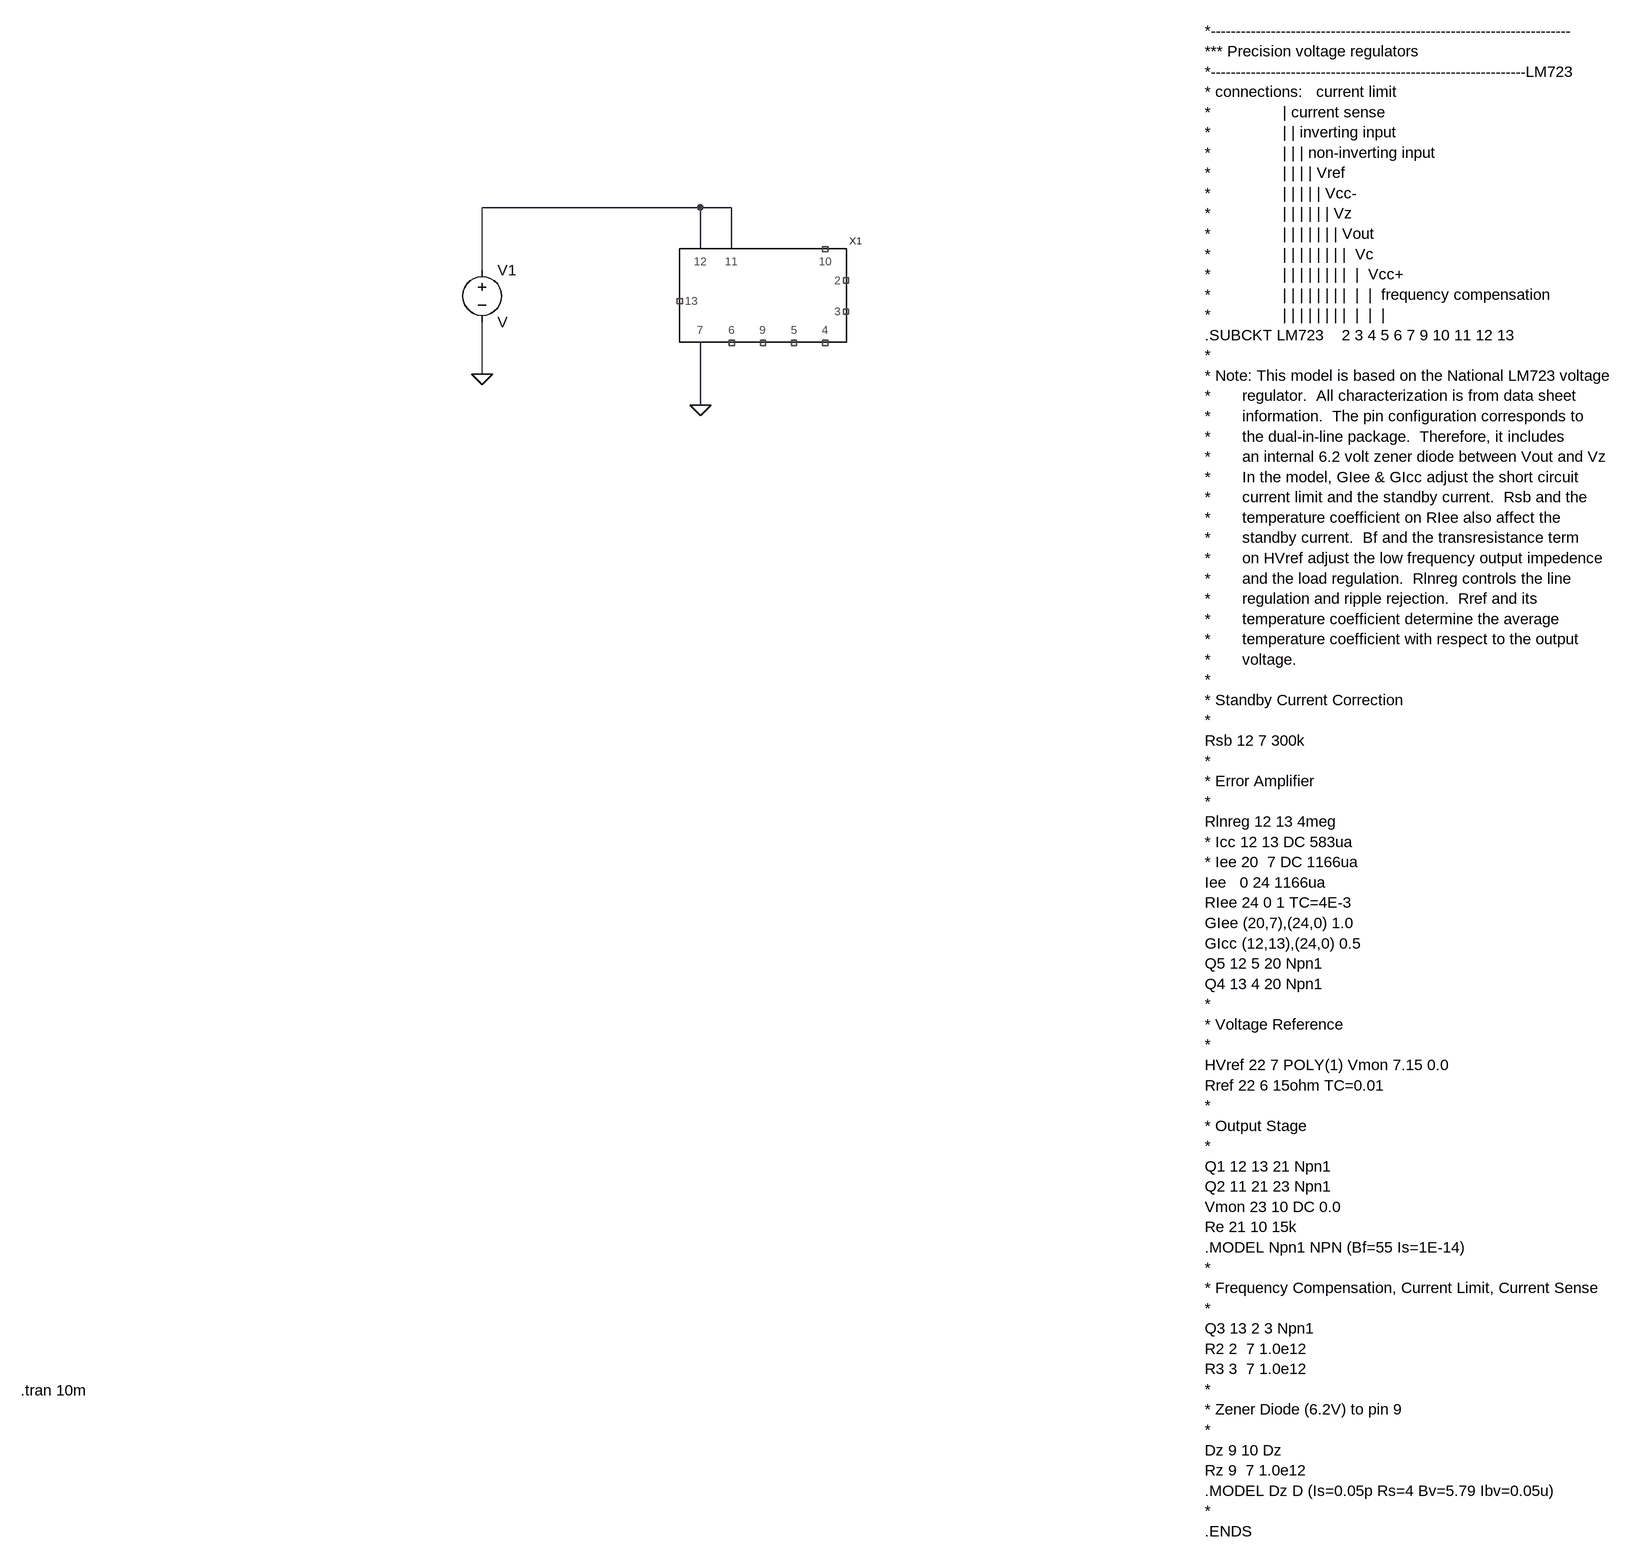
[diagram p0: schematic Draft2.asc]
Draft2.asc, the LTspice schematic file:
Version 4
SHEET 1 2652 1644
WIRE 1120 -192 784 -192
WIRE 1168 -192 1120 -192
WIRE 1120 -128 1120 -192
WIRE 1168 -128 1168 -192
WIRE 784 -96 784 -192
WIRE 784 64 784 -16
WIRE 1120 112 1120 16
FLAG 784 64 0
FLAG 1120 112 0
SYMBOL LM723 1216 -48 R0
SYMATTR InstName X1
SYMATTR Prefix X
SYMATTR SpiceModel LM723
SYMBOL voltage 784 -112 R0
SYMATTR InstName V1
TEXT 1896 -464 Left 2 !*------------------------------------------------------------------------\n*** Precision voltage regulators\n*---------------------------------------------------------------LM723\n* connections:   current limit\n*                | current sense\n*                | | inverting input\n*                | | | non-inverting input\n*                | | | | Vref\n*                | | | | | Vcc-\n*                | | | | | | Vz\n*                | | | | | | | Vout\n*                | | | | | | | |  Vc\n*                | | | | | | | |  |  Vcc+\n*                | | | | | | | |  |  |  frequency compensation\n*                | | | | | | | |  |  |  |\n.SUBCKT LM723    2 3 4 5 6 7 9 10 11 12 13\n*\n* Note: This model is based on the National LM723 voltage\n*       regulator.  All characterization is from data sheet\n*       information.  The pin configuration corresponds to\n*       the dual-in-line package.  Therefore, it includes\n*       an internal 6.2 volt zener diode between Vout and Vz\n*       In the model, GIee & GIcc adjust the short circuit\n*       current limit and the standby current.  Rsb and the\n*       temperature coefficient on RIee also affect the\n*       standby current.  Bf and the transresistance term\n*       on HVref adjust the low frequency output impedence\n*       and the load regulation.  Rlnreg controls the line\n*       regulation and ripple rejection.  Rref and its\n*       temperature coefficient determine the average\n*       temperature coefficient with respect to the output\n*       voltage.\n*\n* Standby Current Correction\n*\nRsb 12 7 300k\n*\n* Error Amplifier\n*\nRlnreg 12 13 4meg\n* Icc 12 13 DC 583ua\n* Iee 20  7 DC 1166ua\nIee   0 24 1166ua\nRIee 24 0 1 TC=4E-3\nGIee (20,7),(24,0) 1.0\nGIcc (12,13),(24,0) 0.5\nQ5 12 5 20 Npn1\nQ4 13 4 20 Npn1\n*\n* Voltage Reference\n*\nHVref 22 7 POLY(1) Vmon 7.15 0.0\nRref 22 6 15ohm TC=0.01\n*\n* Output Stage\n*\nQ1 12 13 21 Npn1\nQ2 11 21 23 Npn1\nVmon 23 10 DC 0.0\nRe 21 10 15k\n.MODEL Npn1 NPN (Bf=55 Is=1E-14)\n*\n* Frequency Compensation, Current Limit, Current Sense\n*\nQ3 13 2 3 Npn1\nR2 2  7 1.0e12\nR3 3  7 1.0e12\n*\n* Zener Diode (6.2V) to pin 9\n*\nDz 9 10 Dz\nRz 9  7 1.0e12\n.MODEL Dz D (Is=0.05p Rs=4 Bv=5.79 Ibv=0.05u)\n*\n.ENDS
TEXT 74 1628 Left 2 !.tran 10m

The netlist it stands for:
* Draft2.asc
XX1 NC_01 NC_02 NC_03 NC_04 NC_05 0 NC_06 NC_07 N001 N001 NC_08 LM723  ; pins 2 3 4 5 6 7 9 10 11 12 13
V1 N001 0 V
*------------------------------------------------------------------------
*** Precision voltage regulators
*---------------------------------------------------------------LM723
* connections:   current limit
*                | current sense
*                | | inverting input
*                | | | non-inverting input
*                | | | | Vref
*                | | | | | Vcc-
*                | | | | | | Vz
*                | | | | | | | Vout
*                | | | | | | | |  Vc
*                | | | | | | | |  |  Vcc+
*                | | | | | | | |  |  |  frequency compensation
*                | | | | | | | |  |  |  |
.SUBCKT LM723    2 3 4 5 6 7 9 10 11 12 13
*
* Note: This model is based on the National LM723 voltage
*       regulator.  All characterization is from data sheet
*       information.  The pin configuration corresponds to
*       the dual-in-line package.  Therefore, it includes
*       an internal 6.2 volt zener diode between Vout and Vz
*       In the model, GIee & GIcc adjust the short circuit
*       current limit and the standby current.  Rsb and the
*       temperature coefficient on RIee also affect the
*       standby current.  Bf and the transresistance term
*       on HVref adjust the low frequency output impedence
*       and the load regulation.  Rlnreg controls the line
*       regulation and ripple rejection.  Rref and its
*       temperature coefficient determine the average
*       temperature coefficient with respect to the output
*       voltage.
*
* Standby Current Correction
*
Rsb 12 7 300k
*
* Error Amplifier
*
Rlnreg 12 13 4meg
* Icc 12 13 DC 583ua
* Iee 20  7 DC 1166ua
Iee   0 24 1166ua
RIee 24 0 1 TC=4E-3
GIee (20,7),(24,0) 1.0
GIcc (12,13),(24,0) 0.5
Q5 12 5 20 Npn1
Q4 13 4 20 Npn1
*
* Voltage Reference
*
HVref 22 7 POLY(1) Vmon 7.15 0.0
Rref 22 6 15ohm TC=0.01
*
* Output Stage
*
Q1 12 13 21 Npn1
Q2 11 21 23 Npn1
Vmon 23 10 DC 0.0
Re 21 10 15k
.MODEL Npn1 NPN (Bf=55 Is=1E-14)
*
* Frequency Compensation, Current Limit, Current Sense
*
Q3 13 2 3 Npn1
R2 2  7 1.0e12
R3 3  7 1.0e12
*
* Zener Diode (6.2V) to pin 9
*
Dz 9 10 Dz
Rz 9  7 1.0e12
.MODEL Dz D (Is=0.05p Rs=4 Bv=5.79 Ibv=0.05u)
*
.ENDS
.tran 10m
.backanno
.end